# Altium project K_Cepelis_EKf-24.PrjPcb (part 4 of 6)
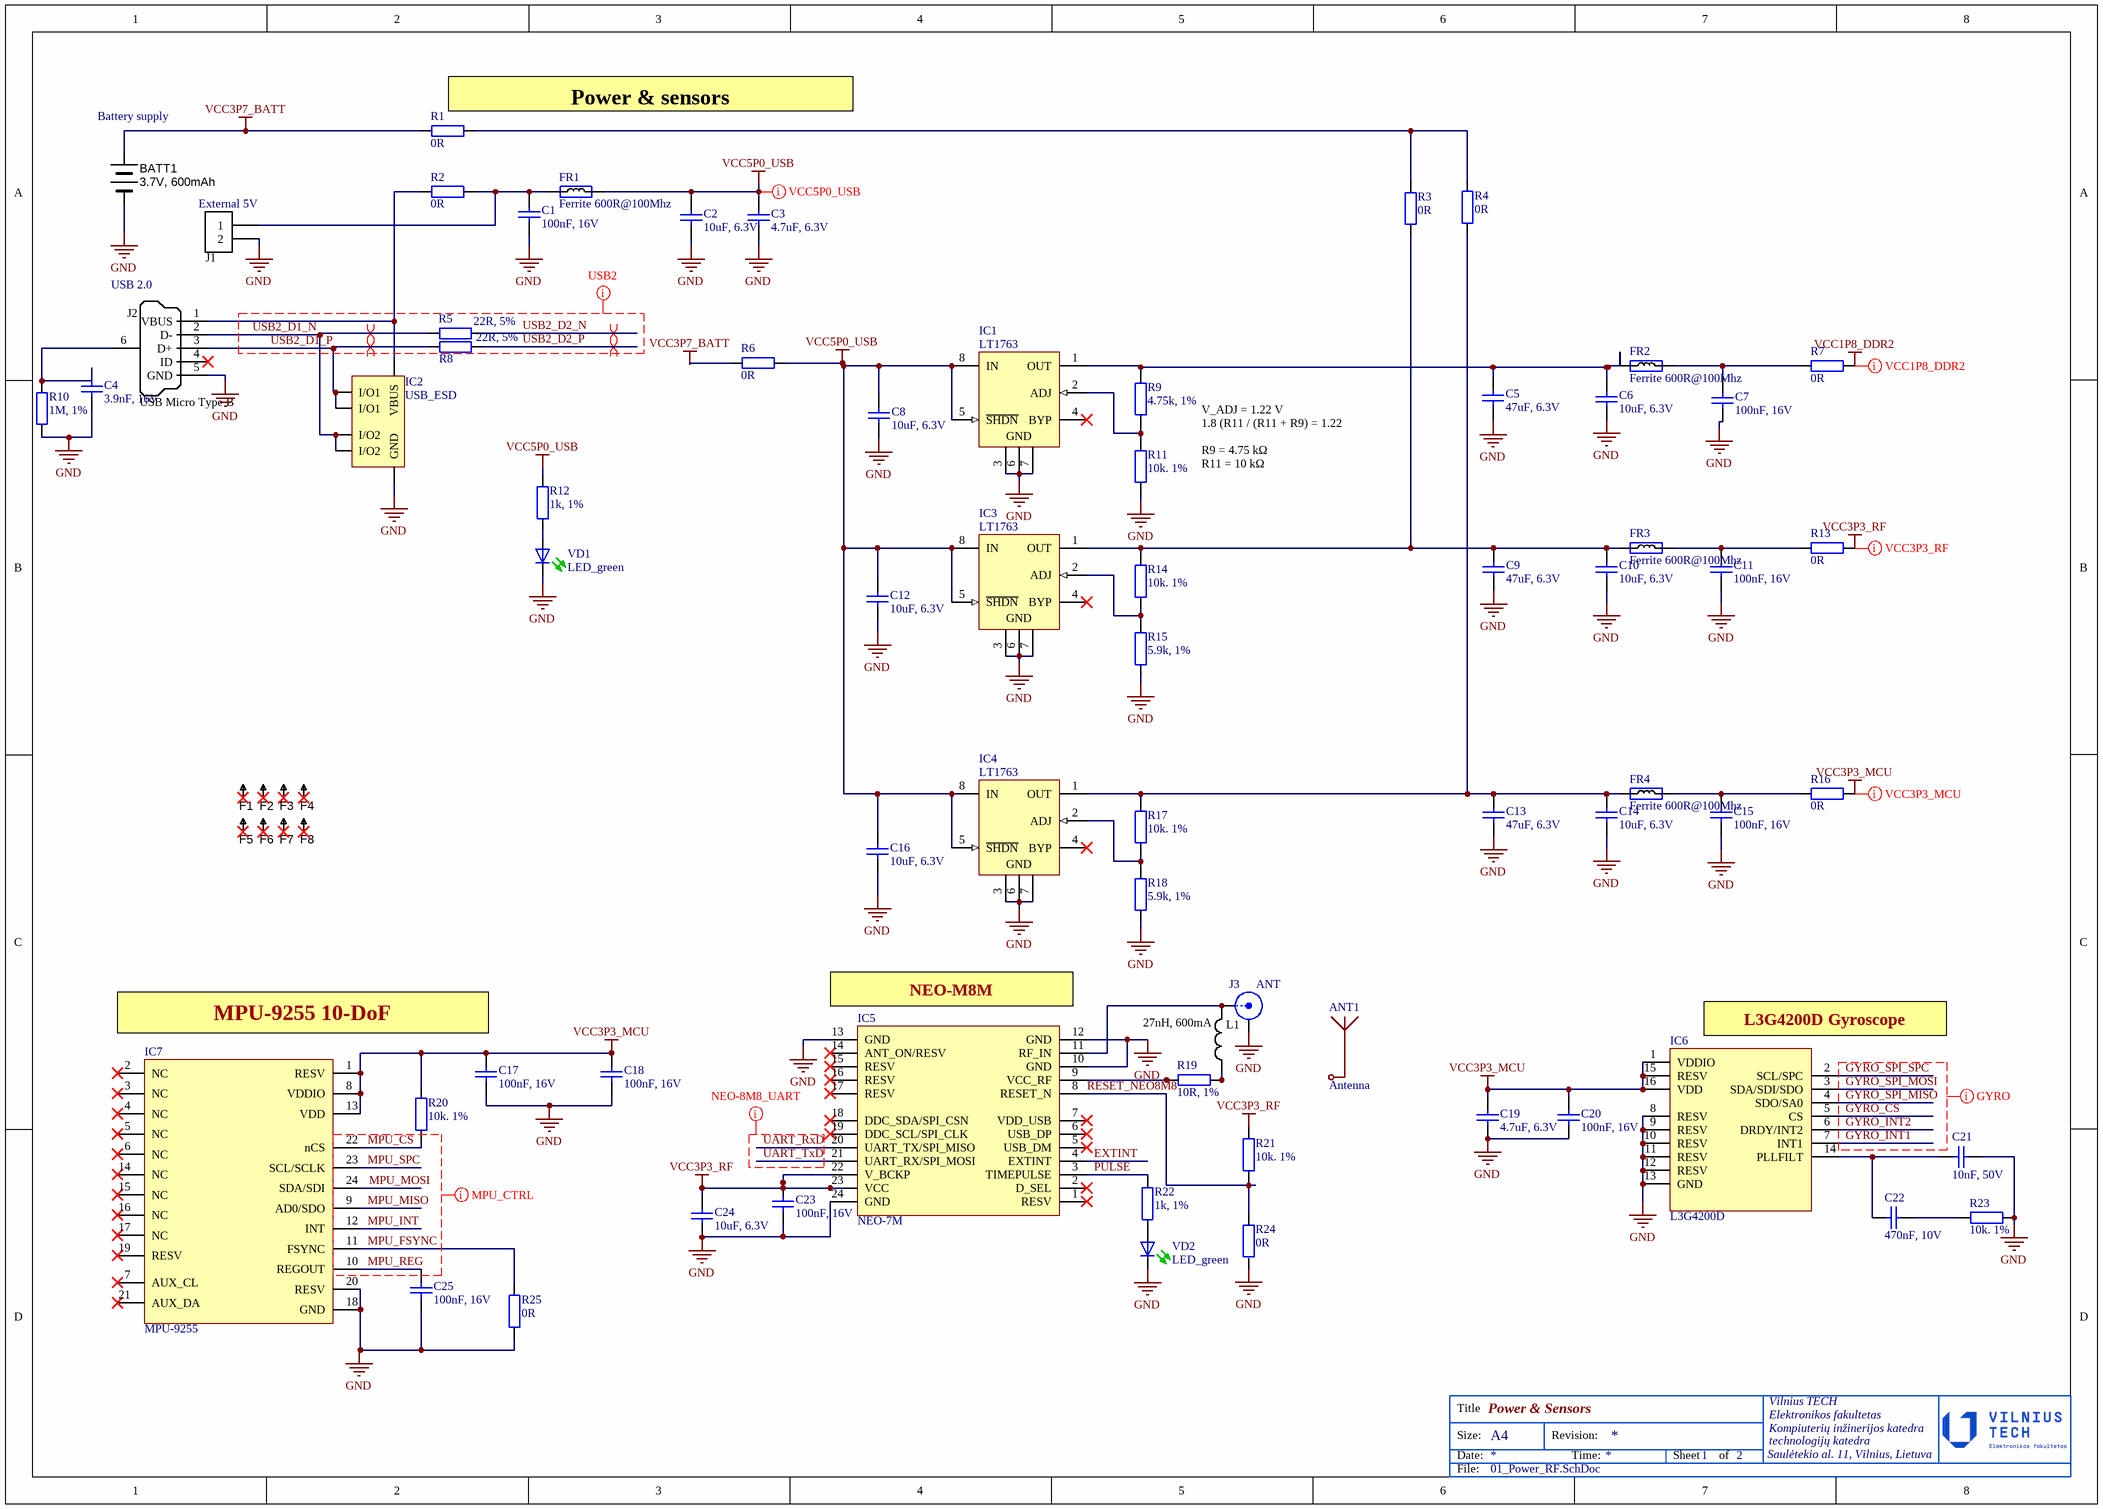
[diagram p4: 01_Power_RF.SchDoc]

## Sheet 01_Power_RF.SchDoc: Power & Sensors (continued)

### Library data of the parts (continued)
R12 R22 = Res: Res Thick Film 0402 1K Ohm 1% 0.063W(1/16W) ±100ppm/C Pad SMD Automotive T/R; Manufacturer: Stackpole Electronics; Manufacturer Part Number: RMCF0402FT1K00; Max Power Dissipation: 63mW; Temperature Coefficient: 100ppm/°C; Voltage Rating: 50V; Value: 1k, 1%; Supplier: Arrow Electronics; Supplier Part Number: RMCF0402FT1K00; RoHS: Compliant; Category: Chip SMD Resistors; Stock: 520000; Pricing: 60000=0.0015 (USD); Case/Package: 0402; Case Code (Imperial): 0402; Case Code (Metric): 1005; China RoHS: Non-Compliant; Composition: Thick Film; Contact Plating: Tin; Country of Origin: Japan, Mainland China, Taiwan; Depth: 500µm; Export Control Classification Number (ECCN) Code: EAR99; Features: Automotive AEC-Q200; Height: 300µm; Harmonized Tariff Schedule (HTS) Code: 8533.21.00.30; Introduction Date: 2011-01-07; Lead Free: Lead Free; Length: 1mm; Lifecycle Status: Production; Max Operating Temperature: 155°C; Military Standard: Not; Min Operating Temperature: -55°C; Mounting Technology: Surface Mount; Pins: 2; Number of Terminals: 2; Number of Terminations: 2; Packaging: Cut Tape (CT); Power Rating: 63mW; Radiation Hardening: No; Ratings: AEC-Q200; REACH SVHC: Yes; Schedule B: 8533210045, 8533210045|8533210045, 8533210045|8533210045|8533210045, 8533210045|8533210045|8533210045|8533210045; Tolerance: 1%; Width: 500µm; Working Voltage: 50V; ComponentLink1URL: https://datasheet.octopart.com:443/RMCF0402FT1K00-Stackpole-Electronics-datasheet-182148065.pdf?src-supplier=IHS; ComponentLink1Description: https://datasheet.octopart.com:443/RMCF0402FT1K00-Stackpole-Electronics-datasheet-182148065.pdf?src-supplier=IHS; ComponentLink2URL: https://datasheet.octopart.com:443/RMCF0402FT1K00-Stackpole-Electronics-datasheet-141193804.pdf?src-supplier=Upverter; ComponentLink2Description: https://datasheet.octopart.com:443/RMCF0402FT1K00-Stackpole-Electronics-datasheet-141193804.pdf?src-supplier=Upverter; ComponentLink3URL: https://datasheet.octopart.com:443/RMCF0402FT1K00-Stackpole-Electronics-datasheet-62091608.pdf?src-supplier=Upverter; ComponentLink3Description: https://datasheet.octopart.com:443/RMCF0402FT1K00-Stackpole-Electronics-datasheet-62091608.pdf?src-supplier=Upverter; ComponentLink4URL: https://datasheet.octopart.com:443/RMCF0402FT1K00-Stackpole-Electronics-datasheet-12534581.pdf?src-supplier=Upverter; ComponentLink4Description: https://datasheet.octopart.com:443/RMCF0402FT1K00-Stackpole-Electronics-datasheet-12534581.pdf?src-supplier=Upverter; ComponentLink5URL: https://datasheet.octopart.com:443/RMCF0402FT1K00-Stackpole-Electronics-datasheet-28504820.pdf?src-supplier=Upverter; ComponentLink5Description: https://datasheet.octopart.com:443/RMCF0402FT1K00-Stackpole-Electronics-datasheet-28504820.pdf?src-supplier=Upverter; ComponentLink6URL: https://datasheet.octopart.com:443/RMCF0402FT1K00-Stackpole-Electronics-datasheet-12510902.pdf?src-supplier=Upverter; ComponentLink6Description: https://datasheet.octopart.com:443/RMCF0402FT1K00-Stackpole-Electronics-datasheet-12510902.pdf?src-supplier=Upverter; ComponentLink7URL: https://datasheet.octopart.com:443/RMCF0402FT1K00-Stackpole-Electronics-datasheet-10788263.pdf?src-supplier=Stackpole+Electronics; ComponentLink7Description: https://datasheet.octopart.com:443/RMCF0402FT1K00-Stackpole-Electronics-datasheet-10788263.pdf?src-supplier=Stackpole+Electronics; ComponentLink8URL: https://datasheet.octopart.com:443/RMCF0402FT1K00-Stackpole-Electronics-datasheet-155966809.pdf?src-supplier=Electro+Sonic; ComponentLink8Description: https://datasheet.octopart.com:443/RMCF0402FT1K00-Stackpole-Electronics-datasheet-155966809.pdf?src-supplier=Electro+Sonic; ComponentLink9URL: https://datasheet.octopart.com:443/RMCF0402FT1K00-Stackpole-Electronics-datasheet-189104164.pdf?src-supplier=Master+Electronics; ComponentLink9Description: https://datasheet.octopart.com:443/RMCF0402FT1K00-Stackpole-Electronics-datasheet-189104164.pdf?src-supplier=Master+Electronics; ComponentLink10URL: https://datasheet.octopart.com:443/RMCF0402FT1K00-Stackpole-Electronics-datasheet-154799224.pdf?src-supplier=Master+Electronics; ComponentLink10Description: https://datasheet.octopart.com:443/RMCF0402FT1K00-Stackpole-Electronics-datasheet-154799224.pdf?src-supplier=Master+Electronics; ComponentLink11URL: https://datasheet.octopart.com:443/RMCF0402FT1K00-Stackpole-Electronics-datasheet-11546843.pdf?src-supplier=Arrow+Electronics; ComponentLink11Description: https://datasheet.octopart.com:443/RMCF0402FT1K00-Stackpole-Electronics-datasheet-11546843.pdf?src-supplier=Arrow+Electronics; ComponentLink12URL: https://datasheet.octopart.com:443/RMCF0402FT1K00-Stackpole-Electronics-datasheet-11547379.pdf?src-supplier=Future+Electronics; ComponentLink12Description: https://datasheet.octopart.com:443/RMCF0402FT1K00-Stackpole-Electronics-datasheet-11547379.pdf?src-supplier=Future+Electronics; ComponentLink13URL: https://datasheet.octopart.com:443/RMCF0402FT1K00-Stackpole-Electronics-datasheet-8359789.pdf?src-supplier=Future+Electronics; ComponentLink13Description: https://datasheet.octopart.com:443/RMCF0402FT1K00-Stackpole-Electronics-datasheet-8359789.pdf?src-supplier=Future+Electronics; ComponentLink14URL: https://datasheet.octopart.com:443/RMCF0402FT1K00-Stackpole-Electronics-datasheet-8324226.pdf?src-supplier=Future+Electronics; ComponentLink14Description: https://datasheet.octopart.com:443/RMCF0402FT1K00-Stackpole-Electronics-datasheet-8324226.pdf?src-supplier=Future+Electronics; ComponentLink15URL: https://datasheet.octopart.com:443/RMCF0402FT1K00-Stackpole-Electronics-datasheet-8088878.pdf?src-supplier=Future+Electronics; ComponentLink15Description: https://datasheet.octopart.com:443/RMCF0402FT1K00-Stackpole-Electronics-datasheet-8088878.pdf?src-supplier=Future+Electronics; ComponentLink16URL: https://datasheet.octopart.com:443/RMCF0402FT1K00-Stackpole-Electronics-datasheet-5313682.pdf?src-supplier=Future+Electronics; ComponentLink16Description: https://datasheet.octopart.com:443/RMCF0402FT1K00-Stackpole-Electronics-datasheet-5313682.pdf?src-supplier=Future+Electronics; ComponentLink17URL: http://sigma.octopart.com:80/15940719/materials_sheet/Stackpole-Electronics-RMCF0402FT1K00.pdf?src-supplier=Compliance+Statements; ComponentLink17Description: http://sigma.octopart.com:80/15940719/materials_sheet/Stackpole-Electronics-RMCF0402FT1K00.pdf?src-supplier=Compliance+Statements; ComponentLink18URL: http://sigma.octopart.com:80/141158211/reach_statement/Stackpole-Electronics-RMCF0402FT1K00.pdf?src-supplier=Compliance+Statements; ComponentLink18Description: http://sigma.octopart.com:80/141158211/reach_statement/Stackpole-Electronics-RMCF0402FT1K00.pdf?src-supplier=Compliance+Statements; ComponentLink19URL: http://sigma.octopart.com:80/141158212/rohs_statement/Stackpole-Electronics-RMCF0402FT1K00.pdf?src-supplier=Compliance+Statements; ComponentLink19Description: http://sigma.octopart.com:80/141158212/rohs_statement/Stackpole-Electronics-RMCF0402FT1K00.pdf?src-supplier=Compliance+Statements
R15 R18 = Res: Res Thick Film 0402 5.9K Ohm 1% 0.063W ±100ppm/°C Molded SMD Paper T/R; Manufacturer: Stackpole Electronics; Manufacturer Part Number: RMCF0402FT5K90; Max Power Dissipation: 63mW; Voltage Rating: 50V; Value: 5.9k, 1%; Supplier: Arrow Electronics; Supplier Part Number: RMCF0402FT5K90; RoHS: Compliant; Category: Chip SMD Resistors; Stock: 6359; Pricing: 1=0.044, 10=0.0049, 25=0.003, 100=0.0026, 250=0.0022, 500=0.0017, 3000=0.0014, 6000=0.0008 (USD); Case/Package: 0402; Case Code (Imperial): 0402; Case Code (Metric): 1005; China RoHS: Non-Compliant; Composition: Thick Film; Contact Plating: Tin; Country of Origin: Japan, Mainland China, Taiwan; Export Control Classification Number (ECCN) Code: EAR99; Features: Automotive AEC-Q200; Height: 300µm; Harmonized Tariff Schedule (HTS) Code: 8533.21.00.30; Introduction Date: 2011-01-07; Lead Free: Lead Free; Length: 1mm; Lifecycle Status: Production; Max Operating Temperature: 155°C; Min Operating Temperature: -55°C; Mounting Technology: Surface Mount; Number of Terminals: 2; Number of Terminations: 2; Packaging: Cut Tape (CT); Power Rating: 63mW; Radiation Hardening: No; Ratings: AEC-Q200; REACH SVHC: Yes; Schedule B: 8533210045, 8533210045|8533210045|8533210045|8533210045|8533210045; Temperature Coefficient: 100ppm/°C; Tolerance: 1%; Width: 500µm; Working Voltage: 50V; ComponentLink1URL: https://datasheet.octopart.com:443/RMCF0402FT5K90-Stackpole-Electronics-datasheet-182148065.pdf?src-supplier=IHS; ComponentLink1Description: https://datasheet.octopart.com:443/RMCF0402FT5K90-Stackpole-Electronics-datasheet-182148065.pdf?src-supplier=IHS; ComponentLink2URL: https://datasheet.octopart.com:443/RMCF0402FT5K90-Stackpole-Electronics-datasheet-28504820.pdf?src-supplier=Upverter; ComponentLink2Description: https://datasheet.octopart.com:443/RMCF0402FT5K90-Stackpole-Electronics-datasheet-28504820.pdf?src-supplier=Upverter; ComponentLink3URL: https://datasheet.octopart.com:443/RMCF0402FT5K90-Stackpole-Electronics-datasheet-141193804.pdf?src-supplier=Master+Electronics; ComponentLink3Description: https://datasheet.octopart.com:443/RMCF0402FT5K90-Stackpole-Electronics-datasheet-141193804.pdf?src-supplier=Master+Electronics; ComponentLink4URL: https://datasheet.octopart.com:443/RMCF0402FT5K90-Stackpole-Electronics-datasheet-116606903.pdf?src-supplier=Master+Electronics; ComponentLink4Description: https://datasheet.octopart.com:443/RMCF0402FT5K90-Stackpole-Electronics-datasheet-116606903.pdf?src-supplier=Master+Electronics; ComponentLink5URL: https://datasheet.octopart.com:443/RMCF0402FT5K90-Stackpole-Electronics-datasheet-189104163.pdf?src-supplier=Master+Electronics; ComponentLink5Description: https://datasheet.octopart.com:443/RMCF0402FT5K90-Stackpole-Electronics-datasheet-189104163.pdf?src-supplier=Master+Electronics; ComponentLink6URL: https://datasheet.octopart.com:443/RMCF0402FT5K90-Stackpole-Electronics-datasheet-62091608.pdf?src-supplier=Stackpole+Electronics; ComponentLink6Description: https://datasheet.octopart.com:443/RMCF0402FT5K90-Stackpole-Electronics-datasheet-62091608.pdf?src-supplier=Stackpole+Electronics; ComponentLink7URL: https://datasheet.octopart.com:443/RMCF0402FT5K90-Stackpole-Electronics-datasheet-12534581.pdf?src-supplier=Stackpole+Electronics; ComponentLink7Description: https://datasheet.octopart.com:443/RMCF0402FT5K90-Stackpole-Electronics-datasheet-12534581.pdf?src-supplier=Stackpole+Electronics; ComponentLink8URL: https://datasheet.octopart.com:443/RMCF0402FT5K90-Stackpole-Electronics-datasheet-10788263.pdf?src-supplier=Stackpole+Electronics; ComponentLink8Description: https://datasheet.octopart.com:443/RMCF0402FT5K90-Stackpole-Electronics-datasheet-10788263.pdf?src-supplier=Stackpole+Electronics; ComponentLink9URL: http://sigma.octopart.com:80/15940719/materials_sheet/Stackpole-Electronics-RMCF0402FT5K90.pdf?src-supplier=Compliance+Statements; ComponentLink9Description: http://sigma.octopart.com:80/15940719/materials_sheet/Stackpole-Electronics-RMCF0402FT5K90.pdf?src-supplier=Compliance+Statements; ComponentLink10URL: http://sigma.octopart.com:80/141158211/reach_statement/Stackpole-Electronics-RMCF0402FT5K90.pdf?src-supplier=Compliance+Statements; ComponentLink10Description: http://sigma.octopart.com:80/141158211/reach_statement/Stackpole-Electronics-RMCF0402FT5K90.pdf?src-supplier=Compliance+Statements; ComponentLink11URL: http://sigma.octopart.com:80/141158212/rohs_statement/Stackpole-Electronics-RMCF0402FT5K90.pdf?src-supplier=Compliance+Statements; ComponentLink11Description: http://sigma.octopart.com:80/141158212/rohs_statement/Stackpole-Electronics-RMCF0402FT5K90.pdf?src-supplier=Compliance+Statements
R19 = Res: Res Thick Film 0402 10 Ohm 1% 0.063W(1/16W) ±100ppm/C Pad SMD Automotive T/R; Manufacturer: Stackpole Electronics; Manufacturer Part Number: RMCF0402FT10R0; Max Power Dissipation: 63mW; Temperature Coefficient: 100ppm/°C; Voltage Rating: 50V; Value: 10R, 1%; Supplier: Arrow Electronics; Supplier Part Number: RMCF0402FT10R0; RoHS: Compliant; Category: Chip SMD Resistors; Stock: 180000; Pricing: 60000=0.0016 (USD); Case/Package: 0402; Case Code (Imperial): 0402; Case Code (Metric): 1005; China RoHS: Non-Compliant; Composition: Thick Film; Contact Plating: Tin; Country of Origin: Japan, Mainland China, Taiwan; Depth: 500µm; Export Control Classification Number (ECCN) Code: EAR99; Features: Automotive AEC-Q200; Height: 300µm; Harmonized Tariff Schedule (HTS) Code: 8533.21.00.30; Introduction Date: 2011-01-07; Lead Free: Lead Free; Length: 1mm; Lifecycle Status: Production; Max Operating Temperature: 155°C; Military Standard: Not; Min Operating Temperature: -55°C; Mounting Technology: Surface Mount; Number of Terminals: 2; Number of Terminations: 2; Packaging: Cut Tape (CT); Power Rating: 63mW; Radiation Hardening: No; Ratings: AEC-Q200; REACH SVHC: Yes; Schedule B: 8533210045, 8533210045|8533210045|8533210045|8533210045|8533210045|8533210045|8533210045|8533210045|8533210045|8533210045|8533210045|8533210045|8533210045|8533210045|8533210045|8533210045|8533210045|8533210045|8533210045|8533210045|8533210045|8533210045|8533210045|85; Tolerance: 1%; Width: 500µm; Working Voltage: 50V; ComponentLink1URL: https://datasheet.octopart.com:443/RMCF0402FT10R0-Stackpole-Electronics-datasheet-182148065.pdf?src-supplier=IHS; ComponentLink1Description: https://datasheet.octopart.com:443/RMCF0402FT10R0-Stackpole-Electronics-datasheet-182148065.pdf?src-supplier=IHS; ComponentLink2URL: https://datasheet.octopart.com:443/RMCF0402FT10R0-Stackpole-Electronics-datasheet-141193804.pdf?src-supplier=Master+Electronics; ComponentLink2Description: https://datasheet.octopart.com:443/RMCF0402FT10R0-Stackpole-Electronics-datasheet-141193804.pdf?src-supplier=Master+Electronics; ComponentLink3URL: https://datasheet.octopart.com:443/RMCF0402FT10R0-Stackpole-Electronics-datasheet-189104163.pdf?src-supplier=Master+Electronics; ComponentLink3Description: https://datasheet.octopart.com:443/RMCF0402FT10R0-Stackpole-Electronics-datasheet-189104163.pdf?src-supplier=Master+Electronics; ComponentLink4URL: https://datasheet.octopart.com:443/RMCF0402FT10R0-Stackpole-Electronics-datasheet-116606903.pdf?src-supplier=Master+Electronics; ComponentLink4Description: https://datasheet.octopart.com:443/RMCF0402FT10R0-Stackpole-Electronics-datasheet-116606903.pdf?src-supplier=Master+Electronics; ComponentLink5URL: https://datasheet.octopart.com:443/RMCF0402FT10R0-Stackpole-Electronics-datasheet-62091608.pdf?src-supplier=Upverter; ComponentLink5Description: https://datasheet.octopart.com:443/RMCF0402FT10R0-Stackpole-Electronics-datasheet-62091608.pdf?src-supplier=Upverter; ComponentLink6URL: https://datasheet.octopart.com:443/RMCF0402FT10R0-Stackpole-Electronics-datasheet-28504820.pdf?src-supplier=Upverter; ComponentLink6Description: https://datasheet.octopart.com:443/RMCF0402FT10R0-Stackpole-Electronics-datasheet-28504820.pdf?src-supplier=Upverter; ComponentLink7URL: https://datasheet.octopart.com:443/RMCF0402FT10R0-Stackpole-Electronics-datasheet-12534581.pdf?src-supplier=Stackpole+Electronics; ComponentLink7Description: https://datasheet.octopart.com:443/RMCF0402FT10R0-Stackpole-Electronics-datasheet-12534581.pdf?src-supplier=Stackpole+Electronics; ComponentLink8URL: https://datasheet.octopart.com:443/RMCF0402FT10R0-Stackpole-Electronics-datasheet-10788263.pdf?src-supplier=Stackpole+Electronics; ComponentLink8Description: https://datasheet.octopart.com:443/RMCF0402FT10R0-Stackpole-Electronics-datasheet-10788263.pdf?src-supplier=Stackpole+Electronics; ComponentLink9URL: https://datasheet.octopart.com:443/RMCF0402FT10R0-Stackpole-Electronics-datasheet-12510902.pdf?src-supplier=Future+Electronics; ComponentLink9Description: https://datasheet.octopart.com:443/RMCF0402FT10R0-Stackpole-Electronics-datasheet-12510902.pdf?src-supplier=Future+Electronics; ComponentLink10URL: http://sigma.octopart.com:80/15940719/materials_sheet/Stackpole-Electronics-RMCF0402FT10R0.pdf?src-supplier=Compliance+Statements; ComponentLink10Description: http://sigma.octopart.com:80/15940719/materials_sheet/Stackpole-Electronics-RMCF0402FT10R0.pdf?src-supplier=Compliance+Statements; ComponentLink11URL: http://sigma.octopart.com:80/141158211/reach_statement/Stackpole-Electronics-RMCF0402FT10R0.pdf?src-supplier=Compliance+Statements; ComponentLink11Description: http://sigma.octopart.com:80/141158211/reach_statement/Stackpole-Electronics-RMCF0402FT10R0.pdf?src-supplier=Compliance+Statements; ComponentLink12URL: http://sigma.octopart.com:80/141158212/rohs_statement/Stackpole-Electronics-RMCF0402FT10R0.pdf?src-supplier=Compliance+Statements; ComponentLink12Description: http://sigma.octopart.com:80/141158212/rohs_statement/Stackpole-Electronics-RMCF0402FT10R0.pdf?src-supplier=Compliance+Statements
VD1 VD2 = LED_green: Light Emitting Diode/LED 0603 super bright Yellow green 568nm 12mcd paste; Manufacturer: Kingbright; Manufacturer Part Number: KPT-1608SGC; Forward Current: 25mA; Forward Voltage: 2.2V; Lens Color: Clear; Lens Style: Colorless, Diffused, Rectangular; Luminous Intensity: 15mcd; Max Junction Temperature (Tj): 110°C; Number of Circuits: 1; Peak Wavelength: 565nm; Power Dissipation: 62.5mW; Reverse Voltage: 5V; Shape: Rectangular; Viewing Angle: 120°; Supplier: Farnell; Supplier Part Number: KPT-1608SGC; RoHS: Compliant; Category: LEDs; Stock: 18000; Pricing: 2000=0.07, 6000=0.0686 (EUR); Case/Package: 0603; China RoHS: Compliant; Color: Green; Country of Origin: Mainland China; Dominant Wavelength: 568nm; Height: 750µm; Harmonized Tariff Schedule (HTS) Code: 8541.40.20.00; Introduction Date: 1999-05-04; Lifecycle Status: Production; Max Operating Temperature: 85°C; Min Operating Temperature: -40°C; Mounting Technology: Surface Mount; Number of LEDs: 1; Pins: 2; Number of Terminals: 2; Packaging: Cut Tape; Radiation Hardening: No; REACH SVHC: Yes; Terminal Pitch: 1.65mm; Wavelength: 568nm; ComponentLink1URL: https://datasheet.octopart.com:443/KPT-1608SGC-Kingbright-datasheet-180521090.pdf?src-supplier=IHS; ComponentLink1Description: https://datasheet.octopart.com:443/KPT-1608SGC-Kingbright-datasheet-180521090.pdf?src-supplier=IHS; ComponentLink2URL: https://datasheet.octopart.com:443/KPT-1608SGC-Kingbright-datasheet-180510520.pdf?src-supplier=IHS; ComponentLink2Description: https://datasheet.octopart.com:443/KPT-1608SGC-Kingbright-datasheet-180510520.pdf?src-supplier=IHS; ComponentLink3URL: https://datasheet.octopart.com:443/KPT-1608SGC-Kingbright-datasheet-138896655.pdf?src-supplier=Upverter; ComponentLink3Description: https://datasheet.octopart.com:443/KPT-1608SGC-Kingbright-datasheet-138896655.pdf?src-supplier=Upverter; ComponentLink4URL: https://datasheet.octopart.com:443/KPT-1608SGC-Kingbright-datasheet-62316560.pdf?src-supplier=element14+APAC; ComponentLink4Description: https://datasheet.octopart.com:443/KPT-1608SGC-Kingbright-datasheet-62316560.pdf?src-supplier=element14+APAC; ComponentLink5URL: https://datasheet.octopart.com:443/KPT-1608SGC-Kingbright-datasheet-10923609.pdf?src-supplier=element14+APAC; ComponentLink5Description: https://datasheet.octopart.com:443/KPT-1608SGC-Kingbright-datasheet-10923609.pdf?src-supplier=element14+APAC; ComponentLink6URL: https://datasheet.octopart.com:443/KPT-1608SGC-Kingbright-datasheet-133513926.pdf?src-supplier=TME; ComponentLink6Description: https://datasheet.octopart.com:443/KPT-1608SGC-Kingbright-datasheet-133513926.pdf?src-supplier=TME; ComponentLink7URL: https://datasheet.octopart.com:443/KPT-1608SGC-Kingbright-datasheet-104959244.pdf?src-supplier=TME; ComponentLink7Description: https://datasheet.octopart.com:443/KPT-1608SGC-Kingbright-datasheet-104959244.pdf?src-supplier=TME; ComponentLink8URL: https://datasheet.octopart.com:443/KPT-1608SGC-Kingbright-datasheet-8328416.pdf?src-supplier=Sager+Electronics; ComponentLink8Description: https://datasheet.octopart.com:443/KPT-1608SGC-Kingbright-datasheet-8328416.pdf?src-supplier=Sager+Electronics

## Sheet 02_MCU_DDR.SchDoc: MCU & DDR
size A3; Date: 2026-05-09; Author: Kristijonas Čepelis; CompanyName: technologijų katedra; DrawnBy: Kristijonas Čepelis; Engineer: Kristijonas Čepelis; Organization: Vilnius TECH; Address1: Elektronikos fakultetas; Address2: Kompiuterių inžinerijos katedra; Address3: Saulėtekio al. 11,; Address4: Vilnius, Lietuva; DocumentNumber: 2; SheetNumber: 2; SheetTotal: 2
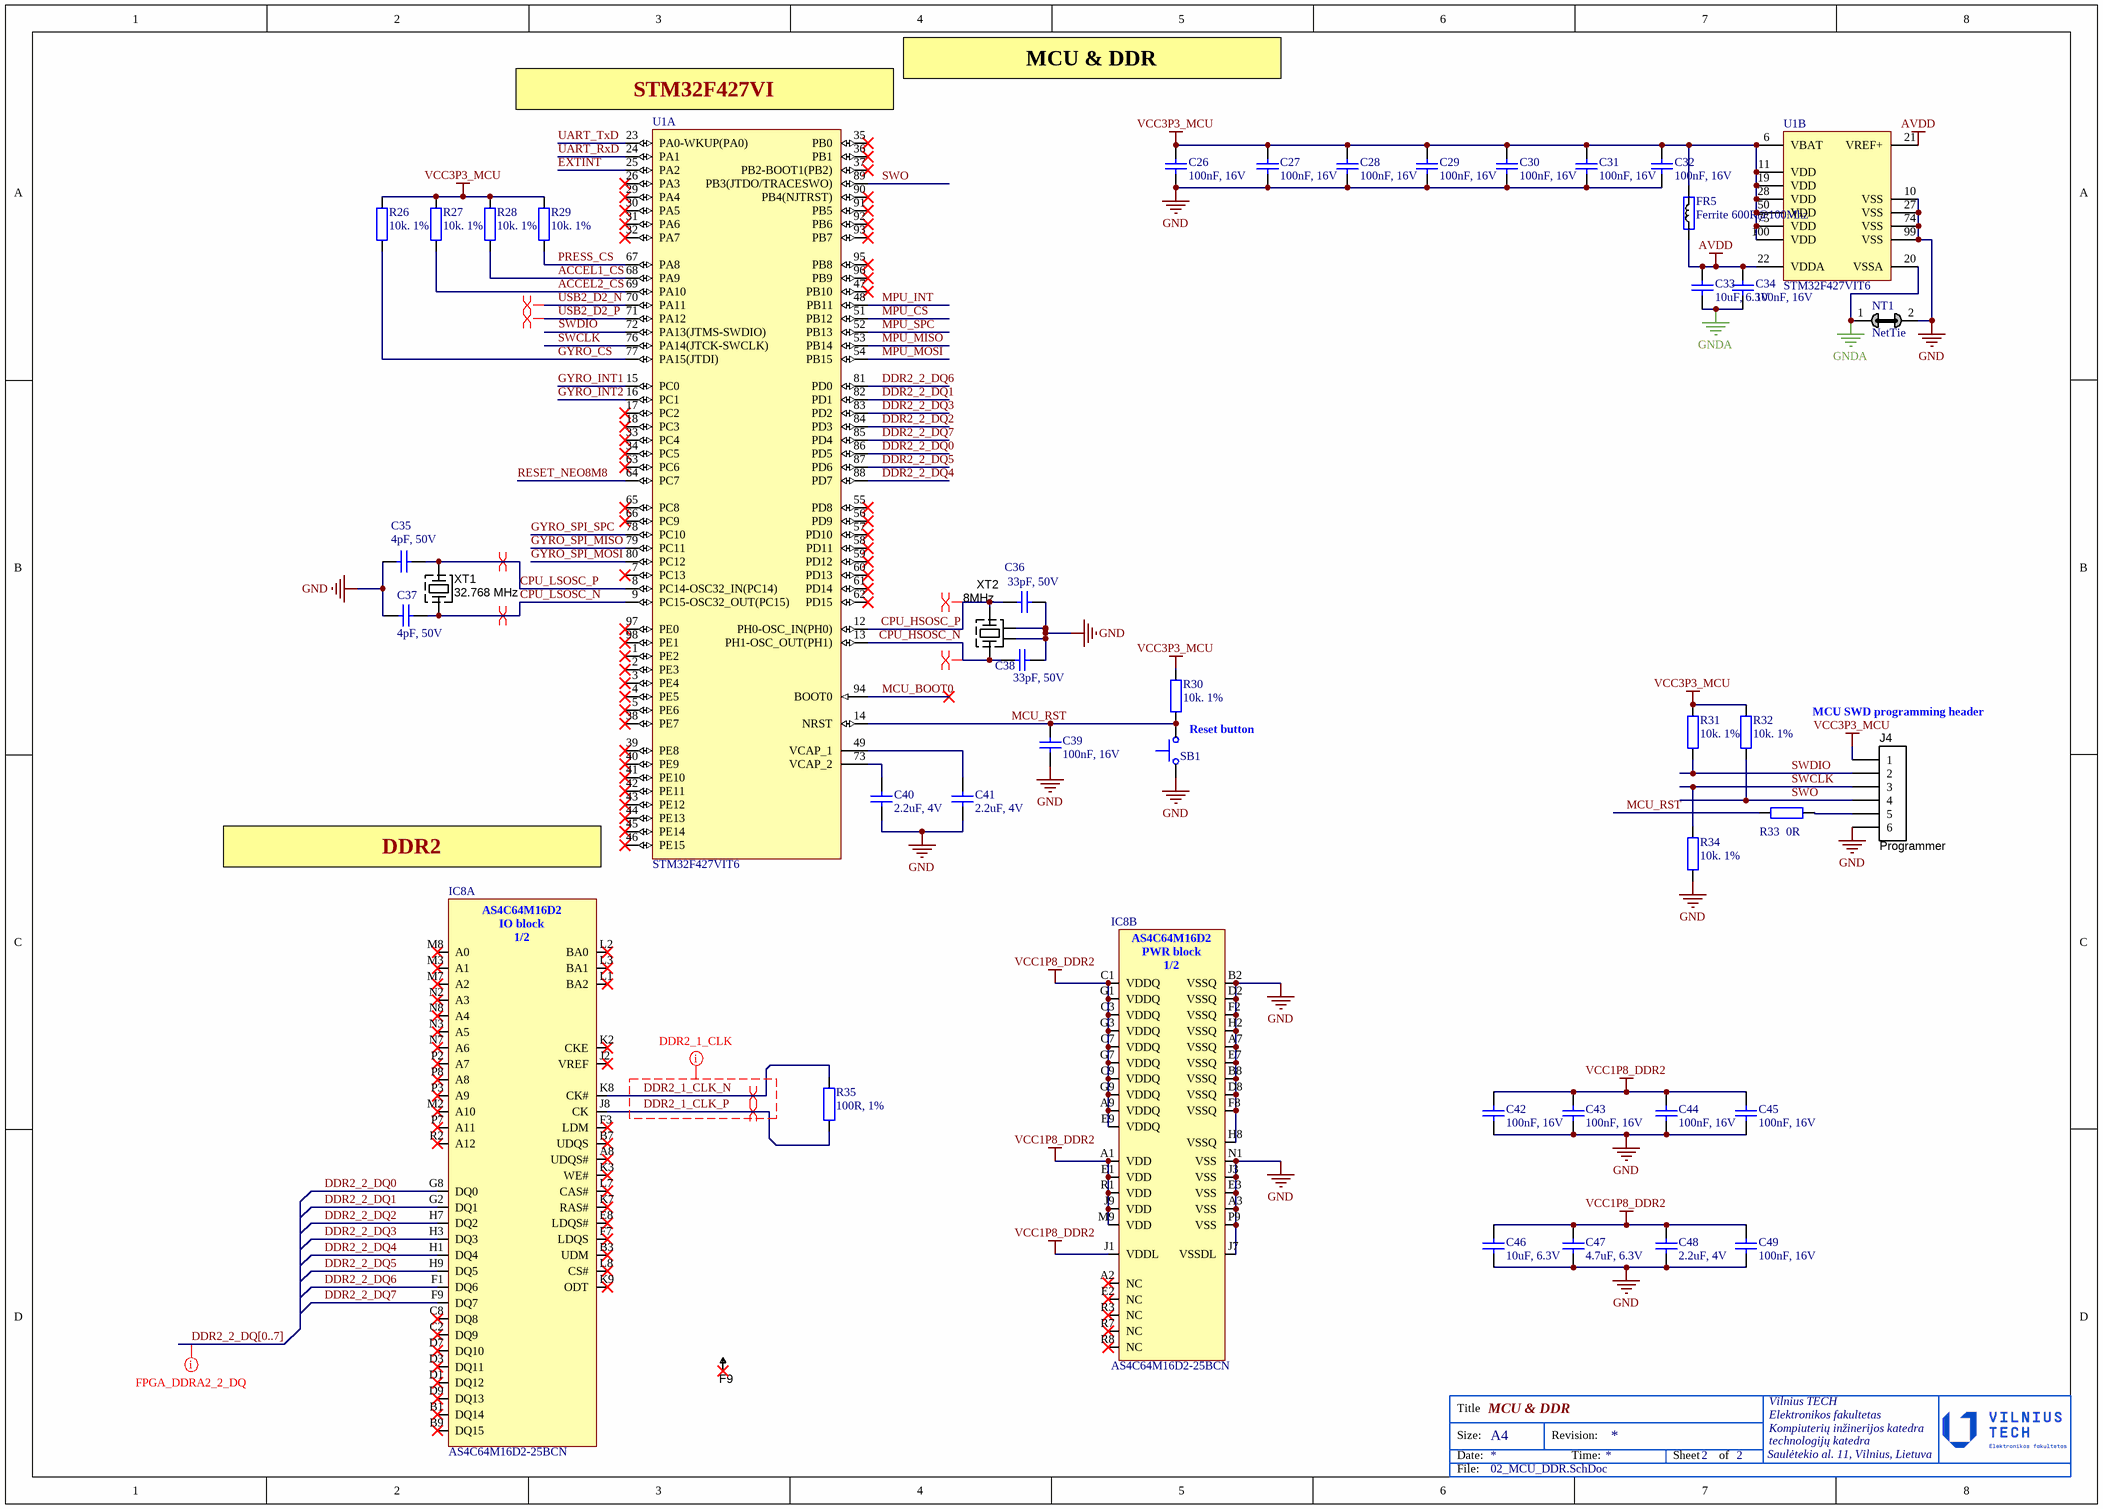
[diagram p1: 02_MCU_DDR.SchDoc]

### Parts
C26  100nF, 16V  [CAP0402]
C27  100nF, 16V  [CAP0402]
C28  100nF, 16V  [CAP0402]
C29  100nF, 16V  [CAP0402]
C30  100nF, 16V  [CAP0402]
C31  100nF, 16V  [CAP0402]
C32  100nF, 16V  [CAP0402]
C33  10uF, 6.3V  [CAP0402]
C34  100nF, 16V  [CAP0402]
C35  4pF, 50V  [CAP0402]
C36  33pF, 50V  [CAP0402]
C37  4pF, 50V  [CAP0402]
C38  33pF, 50V  [CAP0402]
C39  100nF, 16V  [CAP0402]
C40  2.2uF, 4V  [CAP0402]
C41  2.2uF, 4V  [CAP0402]
C42  100nF, 16V  [CAP0402]
C43  100nF, 16V  [CAP0402]
C44  100nF, 16V  [CAP0402]
C45  100nF, 16V  [CAP0402]
C46  10uF, 6.3V  [CAP0402]
C47  4.7uF, 6.3V  [CAP0402]
C48  2.2uF, 4V  [CAP0402]
C49  100nF, 16V  [CAP0402]
F9  Fiducial  [Fiducial]  (value not drawn)  (no BOM)
FR5  Ferrite 600R@100Mhz  [RES0603]
IC8  AS4C64M16D2-25BCN  [AS4C64M16D2]  (parts A,B of 2)
J4  Programmer  [HDR1X6]
NT1  NetTie  [NetTie_Narrow2]  (net tie, no BOM)
R26  10k. 1%  [RES0402]
R27  10k. 1%  [RES0402]
R28  10k. 1%  [RES0402]
R29  10k. 1%  [RES0402]
R30  10k. 1%  [RES0402]
R31  10k. 1%  [RES0402]
R32  10k. 1%  [RES0402]
R33  0R  [RES0402]
R34  10k. 1%  [RES0402]
R35  100R, 1%  [RES0402]
SB1  Button  [SW_tactile]  (value not drawn)
U1  STM32F427VIT6  [STM-LQFP100_M]  (parts A,B of 2)
XT1  32.768 MHz  [CRYSTAL_v2]
XT2  8MHz  [CRYSTAL_4-LCC]

### Nets
AVDD: C33.2 C34.2 FR5.1 U1.21(VREF+) U1.22(VDDA)
GND: C26.1 C27.1 C28.1 C29.1 C30.1 C31.1 C32.1 C35.1 C36.2 C37.1 C38.2 C39.1 C40.1 C41.1 C42.1 C43.1 C44.1 C45.1 C46.1 C47.1 C48.1 C49.1 IC8.A3(VSS) IC8.A7(VSSQ) IC8.B2(VSSQ) IC8.B8(VSSQ) IC8.D2(VSSQ) IC8.D8(VSSQ) IC8.E3(VSS) IC8.E7(VSSQ) IC8.F2(VSSQ) IC8.F8(VSSQ) IC8.H2(VSSQ) IC8.H8(VSSQ) IC8.J3(VSS) IC8.J7(VSSDL) IC8.N1(VSS) IC8.P9(VSS) J4.6 NT1.2 R34.1 SB1.1 U1.10(VSS) U1.27(VSS) U1.74(VSS) U1.99(VSS) XT2.2(GND) XT2.4(GND)
GNDA: C33.1 C34.1 NT1.1 U1.20(VSSA)
VCC1P8_DDR2: C42.2 C43.2 C44.2 C45.2 C46.2 C47.2 C48.2 C49.2 IC8.A1(VDD) IC8.A9(VDDQ) IC8.C1(VDDQ) IC8.C3(VDDQ) IC8.C7(VDDQ) IC8.C9(VDDQ) IC8.E1(VDD) IC8.E9(VDDQ) IC8.G1(VDDQ) IC8.G3(VDDQ) IC8.G7(VDDQ) IC8.G9(VDDQ) IC8.J1(VDDL) IC8.J9(VDD) IC8.M9(VDD) IC8.R1(VDD)
VCC3P3_MCU: C26.2 C27.2 C28.2 C29.2 C30.2 C31.2 C32.2 FR5.2 J4.1 R26.2 R27.2 R28.2 R29.2 R30.2 R31.2 R32.2 U1.6(VBAT) U1.11(VDD) U1.19(VDD) U1.28(VDD) U1.50(VDD) U1.75(VDD) U1.100(VDD)
ACCEL1_CS: R28.1 U1.68(PA9)
ACCEL2_CS: R27.1 U1.69(PA10)
CPU_HSOSC_N: C38.1 U1.13(PH1-OSC_OUT(PH1)) XT2.1(X)
CPU_HSOSC_P: C36.1 U1.12(PH0-OSC_IN(PH0)) XT2.3(X)
CPU_LSOSC_N: C37.2 U1.9(PC15-OSC32_OUT(PC15)) XT1.1(X)
CPU_LSOSC_P: C35.2 U1.8(PC14-OSC32_IN(PC14)) XT1.2(X)
DDR2_1_CLK_N: IC8.K8(CK#) R35.2
DDR2_1_CLK_P: IC8.J8(CK) R35.1
DDR2_2_DQ0: IC8.G8(DQ0) U1.86(PD5)
DDR2_2_DQ1: IC8.G2(DQ1) U1.82(PD1)
DDR2_2_DQ2: IC8.H7(DQ2) U1.84(PD3)
DDR2_2_DQ3: IC8.H3(DQ3) U1.83(PD2)
DDR2_2_DQ4: IC8.H1(DQ4) U1.88(PD7)
DDR2_2_DQ5: IC8.H9(DQ5) U1.87(PD6)
DDR2_2_DQ6: IC8.F1(DQ6) U1.81(PD0)
DDR2_2_DQ7: IC8.F9(DQ7) U1.85(PD4)
EXTINT: U1.25(PA2)
GYRO_CS: R26.1 U1.77(PA15(JTDI))
GYRO_INT1: U1.15(PC0)
GYRO_INT2: U1.16(PC1)
GYRO_SPI_MISO: U1.79(PC11)
GYRO_SPI_MOSI: U1.80(PC12)
GYRO_SPI_SPC: U1.78(PC10)
MCU_BOOT0: U1.94(BOOT0)
MCU_RST: C39.2 R30.1 R33.1 SB1.2 U1.14(NRST)
MPU_CS: U1.51(PB12)
MPU_INT: U1.48(PB11)
MPU_MISO: U1.53(PB14)
MPU_MOSI: U1.54(PB15)
MPU_SPC: U1.52(PB13)
PRESS_CS: R29.1 U1.67(PA8)
RESET_NEO8M8: U1.64(PC7)
SWCLK: J4.3 R34.2 U1.76(PA14(JTCK-SWCLK))
SWDIO: J4.2 R31.1 U1.72(PA13(JTMS-SWDIO))
SWO: J4.4 R32.1 U1.89(PB3(JTDO/TRACESWO))
UART_RxD: U1.24(PA1)
UART_TxD: U1.23(PA0-WKUP(PA0))
USB2_D2_N: U1.70(PA11)
USB2_D2_P: U1.71(PA12)
NetC40_2: C40.2 U1.73(VCAP_2)
NetC41_2: C41.2 U1.49(VCAP_1)
NetJ4_5: J4.5 R33.2

Not connected (* = marked no-connect by the designer): F9 1*; IC8 A2(NC)* A8(UDQS#)* B1(DQ14)* B3(UDM)* B7(UDQS)* B9(DQ15)* C2(DQ9)* C8(DQ8)* D1(DQ12)* D3(DQ11)* D7(DQ10)* D9(DQ13)* E2(NC)* E8(LDQS#)* F3(LDM)* F7(LDQS)* J2(VREF)* K2(CKE)* K3(WE#)* K7(RAS#)* K9(ODT)* L1(BA2)* L2(BA0)* L3(BA1)* L7(CAS#)* L8(CS#)* M2(A10)* M3(A1)* M7(A2)* M8(A0)* N2(A3)* N3(A5)* N7(A6)* N8(A4)* P2(A7)* P3(A9)* P7(A11)* P8(A8)* R2(A12)* R3(NC)* R7(NC)* R8(NC)*; U1 1(PE2)* 2(PE3)* 3(PE4)* 4(PE5)* 5(PE6)* 7(PC13)* 17(PC2)* 18(PC3)* 26(PA3)* 29(PA4)* 30(PA5)* 31(PA6)* 32(PA7)* 33(PC4)* 34(PC5)* 35(PB0)* 36(PB1)* 37(PB2-BOOT1(PB2))* 38(PE7)* 39(PE8)* 40(PE9)* 41(PE10)* 42(PE11)* 43(PE12)* 44(PE13)* 45(PE14)* 46(PE15)* 47(PB10)* 55(PD8)* 56(PD9)* 57(PD10)* 58(PD11)* 59(PD12)* 60(PD13)* 61(PD14)* 62(PD15)* 63(PC6)* 65(PC8)* 66(PC9)* 90(PB4(NJTRST))* 91(PB5)* 92(PB6)* 93(PB7)* 95(PB8)* 96(PB9)* 97(PE0)* 98(PE1)*

### Buses and harness runs
bus DDR2_2_DQ[0..7]

### Layout directives
differential pair: CPU_HSOSC_N, CPU_HSOSC_P, CPU_LSOSC_N, CPU_LSOSC_P, DDR2_1_CLK_N, DDR2_1_CLK_P, USB2_D2_N, USB2_D2_P
mark named FPGA_DDRA2_2_DQ: (no net found under the mark)
mark named DDR2_1_CLK: DDR2_1_CLK_N, DDR2_1_CLK_P

### Notes on the sheet
- (near U1) STM32F427VI
- MCU & DDR
- (near J4) MCU SWD programming header
- Reset button
- (near U1) DDR2
- Title
- Size:
- Date:
- A4
- Revision:
- Time:
- Sheet
- of
- File:
- (in symbol AS4C64M16D2-25BCN, part A) AS4C64M16D2 / IO block / 1/2
- (in symbol AS4C64M16D2-25BCN, part B) AS4C64M16D2 / PWR block / 1/2